# Altium schematic sheet 2_MCU.SchDoc
size 528 x 337 mm; SheetNumber: 4; SheetTotal: 4
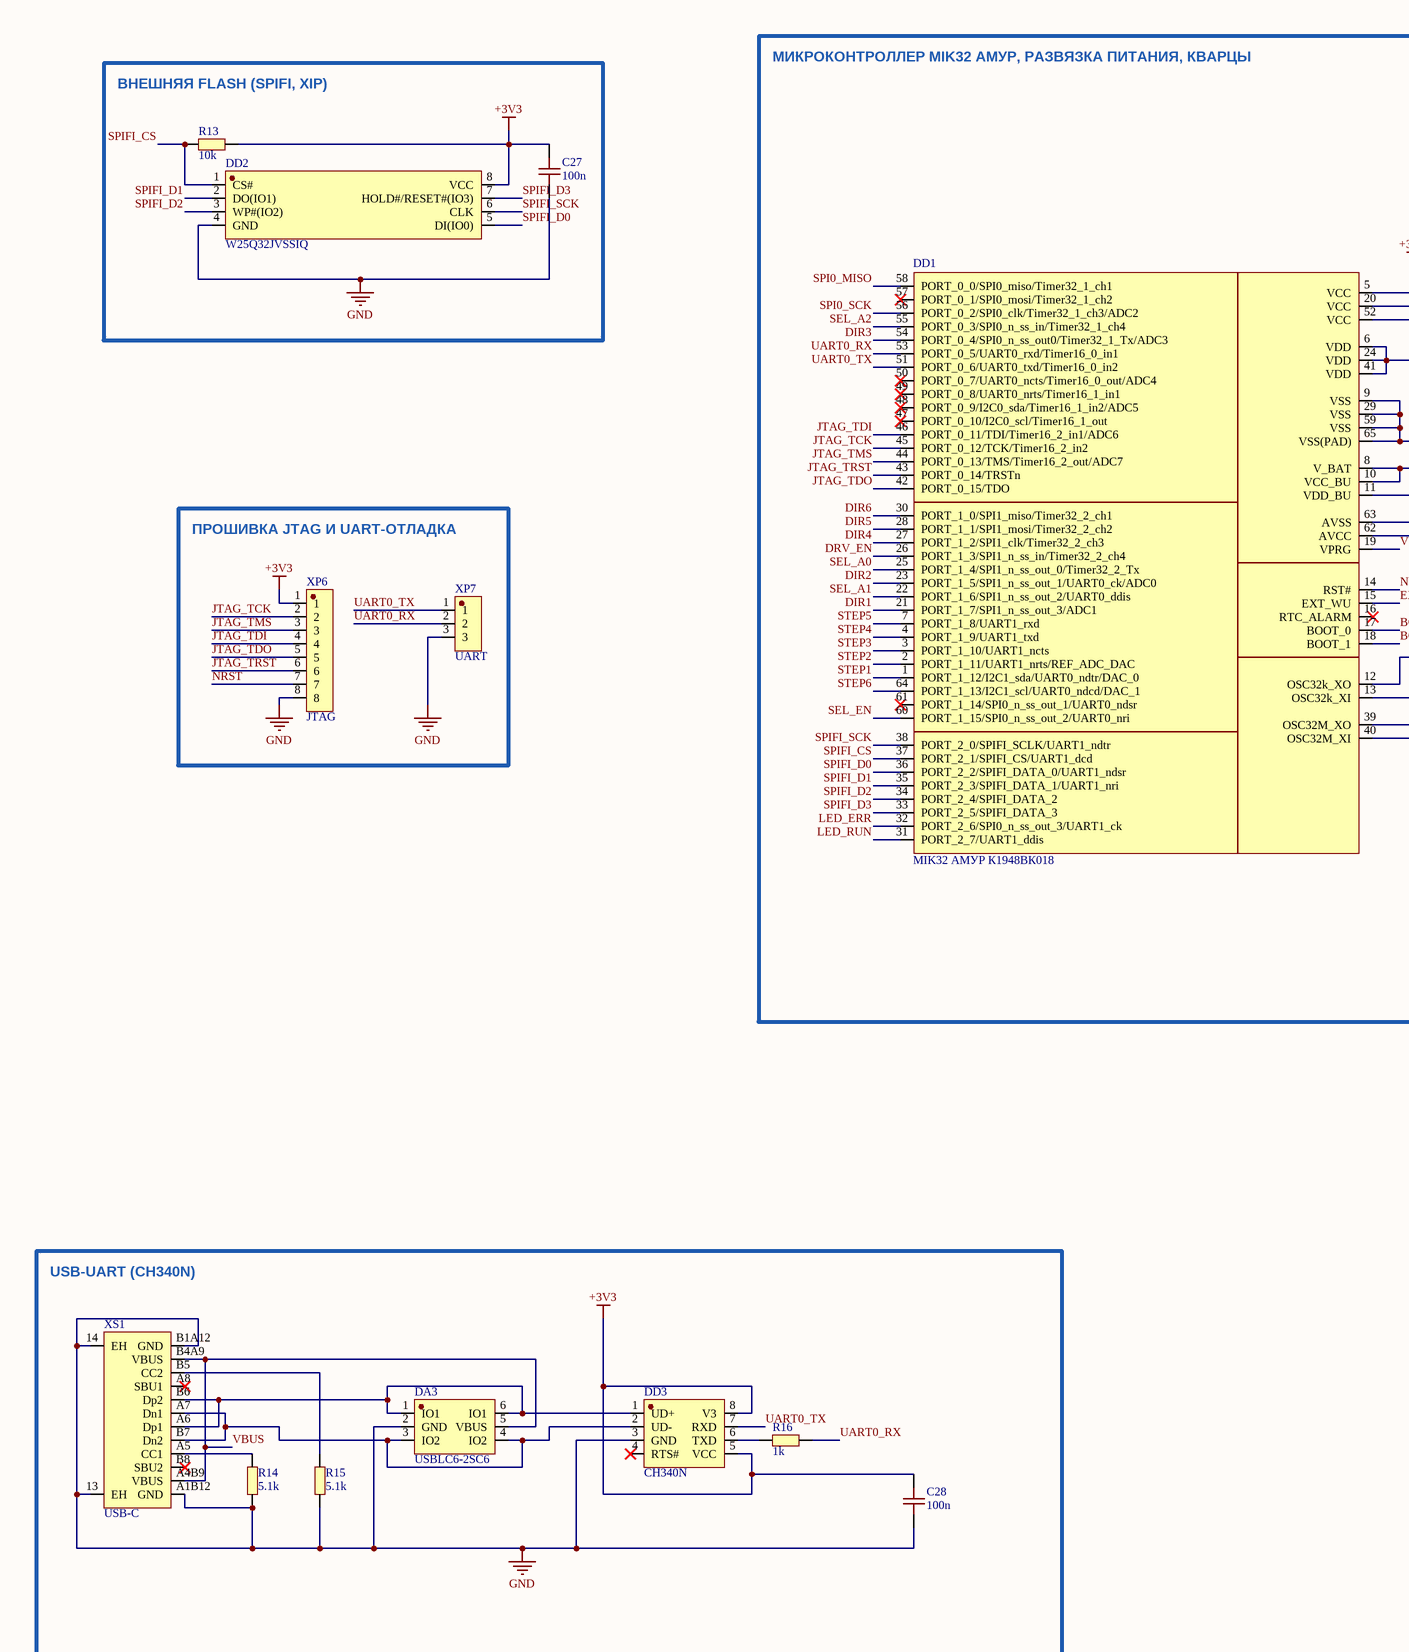
[diagram p0: 2_MCU.SchDoc, left]
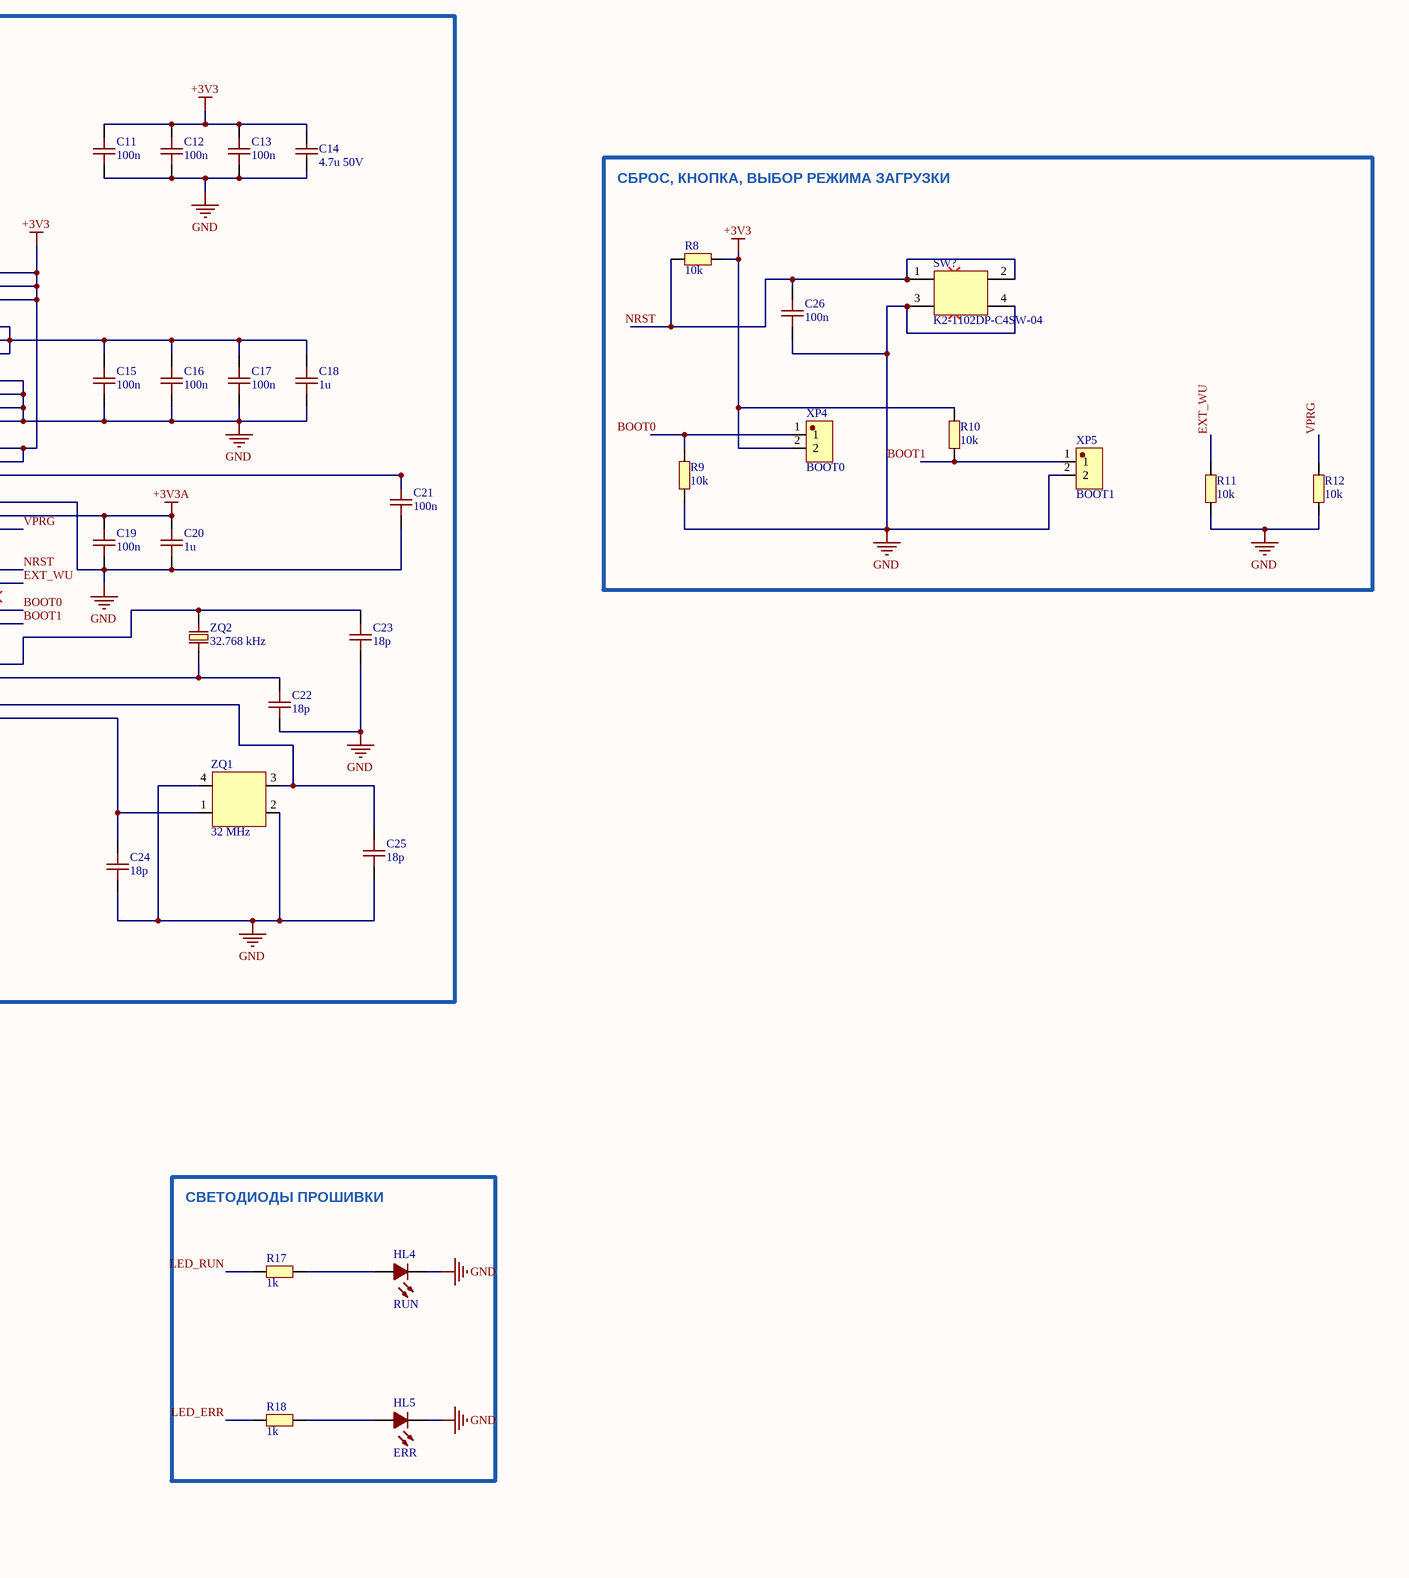
[diagram p1: 2_MCU.SchDoc, right]

## Parts
C11  100n  [C0603]
C12  100n  [C0603]
C13  100n  [C0603]
C14  4.7u 50V  [C1206]
C15  100n  [C0603]
C16  100n  [C0603]
C17  100n  [C0603]
C18  1u  [C0603]
C19  100n  [C0603]
C20  1u  [C0603]
C21  100n  [C0603]
C22  18p  [C0603]
C23  18p  [C0603]
C24  18p  [C0603]
C25  18p  [C0603]
C26  100n  [C0603]
C27  100n  [C0603]
C28  100n  [C0603]
DA3  USBLC6-2SC6  [SOT-23-6_L2.9-W1.6-P0.95-LS2.8-BL]
DD1  MIK32 АМУР К1948ВК018  [QFN-64_MCU32_PROD]
DD2  W25Q32JVSSIQ  [SOIC-8_L5.2-W5.2-P1.27-LS7.9-BL]
DD3  CH340N  [SOP-8_L5.0-W4.0-P1.27-LS6.0-BL]
HL4  RUN  [LED0603-RD_GREEN]
HL5  ERR  [LED0603-RD_GREEN]
R8  10k  [R0603]
R9  10k  [R0603]
R10  10k  [R0603]
R11  10k  [R0603]
R12  10k  [R0603]
R13  10k  [R0603]
R14  5.1k  [R0603]
R15  5.1k  [R0603]
R16  1k  [R0603]
R17  1k  [R0603]
R18  1k  [R0603]
SW?  K2-1102DP-C4SW-04  [KEY-TH_4P-L6.0-W6.0-P4.50-LS6.50]
XP4  BOOT0  [HDR-TH_2P-P2.54-V-M]
XP5  BOOT1  [HDR-TH_2P-P2.54-V-M]
XP6  JTAG  [HDR-TH_8P-P2.54-V-M]
XP7  UART  [HDR-TH_3P-P2.54-V-M_PZ254V-11-03P]
XS1  USB-C  [USB-C-SMD_TYPE-C-16PIN-2MD-073]
ZQ1  32 MHz  [CRYSTAL-SMD_4P-L3.2-W2.5-BL]
ZQ2  32.768 kHz  [FC-135R_L3.2-W1.5]

## Blocks framed on the sheet
ВНЕШНЯЯ FLASH (SPIFI, XIP): C27 DD2 R13
МИКРОКОНТРОЛЛЕР MIK32 АМУР, РАЗВЯЗКА ПИТАНИЯ, КВАРЦЫ: C11-C25 DD1 ZQ1 ZQ2
СБРОС, КНОПКА, ВЫБОР РЕЖИМА ЗАГРУЗКИ: C26 R8-R12 SW? XP4 XP5
ПРОШИВКА JTAG И UART-ОТЛАДКА: XP6 XP7
USB-UART (CH340N): C28 DA3 DD3 R14-R16 XS1
СВЕТОДИОДЫ ПРОШИВКИ: HL4 HL5 R17 R18

## Nets
+3V3: C11.1 C12.1 C13.1 C14.1 C27.1 C28.1 DD1.5(VCC) DD1.8(V_BAT) DD1.10(VCC_BU) DD1.20(VCC) DD1.52(VCC) DD2.8(VCC) DD3.5(VCC) DD3.8(V3) R8.2 R10.2 R13.2 XP4.2 XP6.1
+3V3A: C19.1 C20.1 DD1.62(AVCC)
GND: C11.2 C12.2 C13.2 C14.2 C15.2 C16.2 C17.2 C18.2 C19.2 C20.2 C21.2 C22.2 C23.2 C24.2 C25.2 C26.2 C27.2 C28.2 DA3.2(GND) DD1.9(VSS) DD1.29(VSS) DD1.59(VSS) DD1.63(AVSS) DD1.65(VSS(PAD)) DD2.4(GND) DD3.3(GND) HL4.1(C) HL5.1(C) R9.2 R11.2 R12.2 R14.2 R15.2 SW?.3 SW?.4 XP5.2 XP6.8 XP7.3 XS1.13(EH) XS1.14(EH) XS1.A1B12(GND) XS1.B1A12(GND) ZQ1.2(GND) ZQ1.4(GND)
BOOT0: DD1.17(BOOT_0) R9.1 XP4.1
BOOT1: DD1.18(BOOT_1) R10.1 XP5.1
DIR1: DD1.21(PORT_1_7/SPI1_n_ss_out_3/ADC1)
DIR2: DD1.23(PORT_1_5/SPI1_n_ss_out_1/UART0_ck/ADC0)
DIR3: DD1.54(PORT_0_4/SPI0_n_ss_out0/Timer32_1_Tx/ADC3)
DIR4: DD1.27(PORT_1_2/SPI1_clk/Timer32_2_ch3)
DIR5: DD1.28(PORT_1_1/SPI1_mosi/Timer32_2_ch2)
DIR6: DD1.30(PORT_1_0/SPI1_miso/Timer32_2_ch1)
DRV_EN: DD1.26(PORT_1_3/SPI1_n_ss_in/Timer32_2_ch4)
EXT_WU: DD1.15(EXT_WU) R11.1
JTAG_TCK: DD1.45(PORT_0_12/TCK/Timer16_2_in2) XP6.2
JTAG_TDI: DD1.46(PORT_0_11/TDI/Timer16_2_in1/ADC6) XP6.4
JTAG_TDO: DD1.42(PORT_0_15/TDO) XP6.5
JTAG_TMS: DD1.44(PORT_0_13/TMS/Timer16_2_out/ADC7) XP6.3
JTAG_TRST: DD1.43(PORT_0_14/TRSTn) XP6.6
LED_ERR: DD1.32(PORT_2_6/SPI0_n_ss_out_3/UART1_ck) R18.1
LED_RUN: DD1.31(PORT_2_7/UART1_ddis) R17.1
NRST: C26.1 DD1.14(RST#) R8.1 SW?.1 SW?.2 XP6.7
SEL_A0: DD1.25(PORT_1_4/SPI1_n_ss_out_0/Timer32_2_Tx)
SEL_A1: DD1.22(PORT_1_6/SPI1_n_ss_out_2/UART0_ddis)
SEL_A2: DD1.55(PORT_0_3/SPI0_n_ss_in/Timer32_1_ch4)
SEL_EN: DD1.60(PORT_1_15/SPI0_n_ss_out_2/UART0_nri)
SPI0_MISO: DD1.58(PORT_0_0/SPI0_miso/Timer32_1_ch1)
SPI0_SCK: DD1.56(PORT_0_2/SPI0_clk/Timer32_1_ch3/ADC2)
SPIFI_CS: DD1.37(PORT_2_1/SPIFI_CS/UART1_dcd) DD2.1(CS#) R13.1
SPIFI_D0: DD1.36(PORT_2_2/SPIFI_DATA_0/UART1_ndsr) DD2.5(DI(IO0))
SPIFI_D1: DD1.35(PORT_2_3/SPIFI_DATA_1/UART1_nri) DD2.2(DO(IO1))
SPIFI_D2: DD1.34(PORT_2_4/SPIFI_DATA_2) DD2.3(WP#(IO2))
SPIFI_D3: DD1.33(PORT_2_5/SPIFI_DATA_3) DD2.7(HOLD#/RESET#(IO3))
SPIFI_SCK: DD1.38(PORT_2_0/SPIFI_SCLK/UART1_ndtr) DD2.6(CLK)
STEP1: DD1.1(PORT_1_12/I2C1_sda/UART0_ndtr/DAC_0)
STEP2: DD1.2(PORT_1_11/UART1_nrts/REF_ADC_DAC)
STEP3: DD1.3(PORT_1_10/UART1_ncts)
STEP4: DD1.4(PORT_1_9/UART1_txd)
STEP5: DD1.7(PORT_1_8/UART1_rxd)
STEP6: DD1.64(PORT_1_13/I2C1_scl/UART0_ndcd/DAC_1)
UART0_RX: DD1.53(PORT_0_5/UART0_rxd/Timer16_0_in1) R16.2 XP7.2
UART0_TX: DD1.51(PORT_0_6/UART0_txd/Timer16_0_in2) DD3.7(RXD) XP7.1
VBUS: DA3.5(VBUS) XS1.A4B9(VBUS) XS1.B4A9(VBUS)
VPRG: DD1.19(VPRG) R12.1
NetC15_1: C15.1 C16.1 C17.1 C18.1 DD1.6(VDD) DD1.24(VDD) DD1.41(VDD)
NetC21_1: C21.1 DD1.11(VDD_BU)
NetC22_1: C22.1 DD1.13(OSC32k_XI) ZQ2.1
NetC23_1: C23.1 DD1.12(OSC32k_XO) ZQ2.2
NetC24_1: C24.1 DD1.40(OSC32M_XI) ZQ1.1(OSC1)
NetC25_1: C25.1 DD1.39(OSC32M_XO) ZQ1.3(OSC2)
NetDA3_1: DA3.1(IO1) DA3.6(IO1) DD3.1(UD+) XS1.A6(Dp1) XS1.B6(Dp2)
NetDA3_3: DA3.3(IO2) DA3.4(IO2) DD3.2(UD-) XS1.A7(Dn1) XS1.B7(Dn2)
NetDD3_6: DD3.6(TXD) R16.1
NetHL4_2: HL4.2(A) R17.2
NetHL5_2: HL5.2(A) R18.2
NetR14_1: R14.1 XS1.A5(CC1)
NetR15_1: R15.1 XS1.B5(CC2)

Not connected (* = marked no-connect by the designer): DD1 16(RTC_ALARM)* 47(PORT_0_10/I2C0_scl/Timer16_1_out)* 48(PORT_0_9/I2C0_sda/Timer16_1_in2/ADC5)* 49(PORT_0_8/UART0_nrts/Timer16_1_in1)* 50(PORT_0_7/UART0_ncts/Timer16_0_out/ADC4)* 57(PORT_0_1/SPI0_mosi/Timer32_1_ch2)* 61(PORT_1_14/SPI0_n_ss_out_1/UART0_ndsr)*; DD3 4(RTS#)*; XS1 A8(SBU1)* B8(SBU2)*

## Library data of the parts
C11-C13 C15-C28 = CL10B104KB8NNNC/0603: Manufacturer Part Number: CL10B104KB8NNNC/0603; LCSC Part: C9900007620; Supplier: LCSC; Supplier Part Number: C9900007620; Datasheet: https://www.lcsc.com/datasheet/C9900007620.pdf; Source: JLCEDA/EasyEDA Official Library (https://easyeda.com, https://lceda.cn)
C14 = CL31B475KBHNNNE: 4.7uF (475) ±10% 50V; Manufacturer: SAMSUNG; Value: 4.7uF; Manufacturer Part Number: CL31B475KBHNNNE; LCSC Part: C51205; Supplier: LCSC; Supplier Part Number: C51205; JLCPCB Part Class: Extended Part; Datasheet: https://www.lcsc.com/datasheet/C51205.pdf; LCSC URL: https://lcsc.com/product-detail/Multilayer-Ceramic-Capacitors-MLCC-SMD-SMT_SAMSUNG_CL31B475KBHNNNE_4-7uF-475-10-50V_C51205.html; Source: JLCEDA/EasyEDA Official Library (https://easyeda.com, https://lceda.cn)
DA3 = USBLC6-2SC6_C2827654: Manufacturer: TECH PUBLIC; Manufacturer Part Number: USBLC6-2SC6; LCSC Part: C2827654; Supplier: LCSC; Supplier Part Number: C2827654; JLCPCB Part Class: Extended Part; Datasheet: https://www.lcsc.com/datasheet/C2827654.pdf; Source: JLCEDA/EasyEDA Official Library (https://easyeda.com, https://lceda.cn)
DD1 = MIK32_K1948BK018 [vladkovalev3303]: Manufacturer: Mikron; Manufacturer Part Number: MCU32; EasyEDA Component: c698b5f0ec9d426a8ac2146e656034b7; Source: EasyEDA user library (author: vladkovalev3303), https://easyeda.com/component/c698b5f0ec9d426a8ac2146e656034b7
DD2 = W25Q32JVSSIQ TR: Manufacturer: WINBOND; Manufacturer Part Number: W25Q32JVSSIQ TR; LCSC Part: C2441426; Supplier: LCSC; Supplier Part Number: C2441426; JLCPCB Part Class: Extended Part; Datasheet: https://www.lcsc.com/datasheet/C2441426.pdf; Source: JLCEDA/EasyEDA Official Library (https://easyeda.com, https://lceda.cn)
HL4 HL5 = KT-0603GH: Manufacturer Part Number: KT-0603GH; LCSC Part: C9900005170; Supplier: LCSC; Supplier Part Number: C9900005170; JLCPCB Part Class: Extended Part; Datasheet: https://www.lcsc.com/datasheet/C9900005170.pdf; Source: JLCEDA/EasyEDA Official Library (https://easyeda.com, https://lceda.cn)
R8-R18 = 0603WAF1002T5E: 10KOhm (1002) ±1%; Manufacturer: UNI-ROYAL; Value: 10kΩ; Manufacturer Part Number: 0603WAF1002T5E; LCSC Part: C25804; Supplier: LCSC; Supplier Part Number: C25804; JLCPCB Part Class: Basic Part; Datasheet: https://www.lcsc.com/datasheet/C25804.pdf; LCSC URL: https://lcsc.com/product-detail/Chip-Resistor-Surface-Mount-UniOhm_10KR-1002-1_C25804.html; Source: JLCEDA/EasyEDA Official Library (https://easyeda.com, https://lceda.cn)
XP4 XP5 = PZ254V-11-02P: Manufacturer: XFCN; Manufacturer Part Number: PZ254V-11-02P; LCSC Part: C492401; Supplier: LCSC; Supplier Part Number: C492401; JLCPCB Part Class: Extended Part; Datasheet: https://www.lcsc.com/datasheet/C492401.pdf; LCSC URL: https://lcsc.com/product-detail/New-Arrivals_XFCN-PZ254V-11-02P_C492401.html; Source: JLCEDA/EasyEDA Official Library (https://easyeda.com, https://lceda.cn)
XP6 = PZ254V-11-08P: Manufacturer: XFCN; Manufacturer Part Number: PZ254V-11-08P; LCSC Part: C492407; Supplier: LCSC; Supplier Part Number: C492407; JLCPCB Part Class: Extended Part; Datasheet: https://www.lcsc.com/datasheet/C492407.pdf; LCSC URL: https://lcsc.com/product-detail/New-Arrivals_XFCN-PZ254V-11-08P_C492407.html; Source: JLCEDA/EasyEDA Official Library (https://easyeda.com, https://lceda.cn)
XP7 = PZ254V-11-03P_C2937625: Manufacturer: XFCN; Manufacturer Part Number: PZ254V-11-03P; LCSC Part: C2937625; Supplier: LCSC; Supplier Part Number: C2937625; JLCPCB Part Class: Extended Part; Datasheet: https://www.lcsc.com/datasheet/C2937625.pdf; Source: JLCEDA/EasyEDA Official Library (https://easyeda.com, https://lceda.cn)
XS1 = TYPE-C 16PIN 2MD(073): Manufacturer: SHOU HAN; Manufacturer Part Number: TYPE-C 16PIN 2MD(073); LCSC Part: C2765186; Supplier: LCSC; Supplier Part Number: C2765186; JLCPCB Part Class: Extended Part; Datasheet: https://www.lcsc.com/datasheet/C2765186.pdf; Source: JLCEDA/EasyEDA Official Library (https://easyeda.com, https://lceda.cn)
ZQ1 = X322532MOB4SI: YSX321SL 32MHZ 12PF 10PPM -40~+85; Manufacturer: YXC; Value: 32MHz; Manufacturer Part Number: X322532MOB4SI; LCSC Part: C9009; Supplier: LCSC; Supplier Part Number: C9009; JLCPCB Part Class: Extended Part; Datasheet: https://www.lcsc.com/datasheet/C9009.pdf; LCSC URL: https://lcsc.com/product-detail/SMD-Crystals_YSX321SL-32MHZ-12PF-10PPM-40-85_C9009.html; Source: JLCEDA/EasyEDA Official Library (https://easyeda.com, https://lceda.cn)
ZQ2 = Q13FC1350000400: 32.768KHz ±20ppm 12.5pF; Manufacturer: EPSON; Value: 32.768kHz; Manufacturer Part Number: Q13FC13500004; LCSC Part: C32346; Supplier: LCSC; Supplier Part Number: C32346; JLCPCB Part Class: Basic Part; Datasheet: https://www.lcsc.com/datasheet/C32346.pdf; LCSC URL: https://lcsc.com/product-detail/SMD-Crystals_EPSON_Q13FC1350000400_32-768KHz-20ppm-12-5pF_C32346.html; Source: JLCEDA/EasyEDA Official Library (https://easyeda.com, https://lceda.cn)
DD3 = CH340N: Manufacturer Part Number: CH340N; LCSC Part: C506813; Supplier: LCSC; Supplier Part Number: C506813; JLCPCB Part Class: Extended Part; Datasheet: https://www.lcsc.com/datasheet/C506813.pdf; LCSC URL: https://lcsc.com/product-detail/USB-ICs_WCH-Jiangsu-Qin-Heng-CH340N_C506813.html; Source: JLCEDA/EasyEDA Official Library (https://easyeda.com, https://lceda.cn)
SW? = K2-1102DP-C4SW-04: Manufacturer Part Number: K2-1102DP-C4SW-04; LCSC Part: C110153; Supplier: LCSC; Supplier Part Number: C110153; JLCPCB Part Class: Extended Part; Datasheet: https://www.lcsc.com/datasheet/C110153.pdf; LCSC URL: https://lcsc.com/product-detail/Tactile-Switches_Button6-6-5_C110153.html; Source: JLCEDA/EasyEDA Official Library (https://easyeda.com, https://lceda.cn)